# EAGLE design Breakout_board (EAGLE 9.6.2)
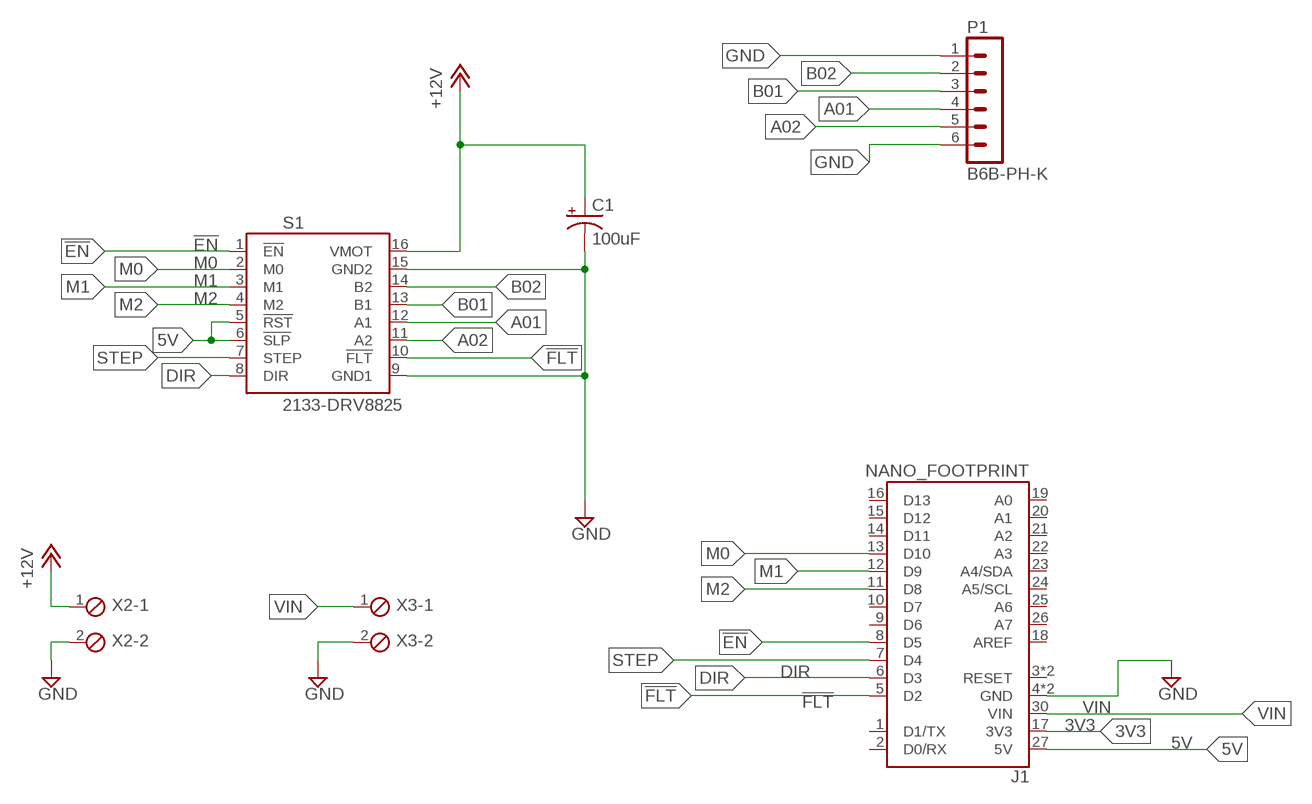
[diagram p0: schematic, sheet 1]

## Parts
C1  100uF  100UF-POLAR-EIA7343-16V-10%(TANT)  [EIA7343]
J1  NANO_FOOTPRINT  [NANO]
P1  B6B-PH-K  [B6B-PH-K]
S1  2133-DRV8825  [DRV8825]
X2  MPT2  [2POL254]
X3  MPT2  [2POL254]

## Nets
3V3: J1.17(3V3)
5V: J1.27(5V) S1.5(!RST) S1.6(!SLP)
!EN: J1.8(D5) S1.1(!EN)
!FLT: J1.5(D2) S1.10(!FLT)
+12V [H_Power]: C1.A(+) S1.16(VMOT) X2.1
A01 [X0]: P1.4 S1.12(A1)
A02 [X0]: P1.5 S1.11(A2)
B01 [X0]: P1.3 S1.13(B1)
B02 [X0]: P1.2 S1.14(B2)
DIR: J1.6(D3) S1.8(DIR)
GND [GND]: C1.C(-) J1.4(GND) J1.29(GND) P1.1 P1.6 S1.9(GND1) S1.15(GND2) X2.2 X3.2
M0: J1.13(D10) S1.2(M0)
M1: J1.12(D9) S1.3(M1)
M2: J1.11(D8) S1.4(M2)
STEP: J1.7(D4) S1.7(STEP)
VIN: J1.30(VIN) X3.1
Unconnected: J1.1(D1/TX) J1.2(D0/RX) J1.3(RESET) J1.9(D6) J1.10(D7) J1.14(D11) J1.15(D12) J1.16(D13) J1.18(AREF) J1.19(A0) J1.20(A1) J1.21(A2) J1.22(A3) J1.23(A4/SDA) J1.24(A5/SCL) J1.25(A6) J1.26(A7) J1.28(RESET)

## Library data of the parts
C1 = SparkFun-Capacitors:100UF-POLAR: 100µF polarized capacitors A capacitor is a passive two-terminal electrical component used to store electrical energy temporarily in an electric field.; PROD_ID: CAP-08702
J1 = SparkFun-Boards:NANO_FOOTPRINT: Generic Nano Footprint
P1 = con-jst-ph:B6B-PH-K: HEADER
S1 = pololu-stepper-driver:2133-DRV8825: DRV8825 Stepper Motor Driver Carrier, High Current #2133 DRV8825 Stepper Motor Driver Carrier; High Current <https://www.pololu.com/product/2133> in Japan, Suzaku Lab. Ltd. <https://suzakugiken.jp/> #2133 DRV8825 大電流用ステッピングモータドライバ <https://szc.jp/po2133>
X2 X3 = con-phoenix-254:MPT2: PHOENIX CONNECTOR; OC_FARNELL: unknown; OC_NEWARK: unknown

## Net classes
1 H_Power: width 0.305 mm

## Board
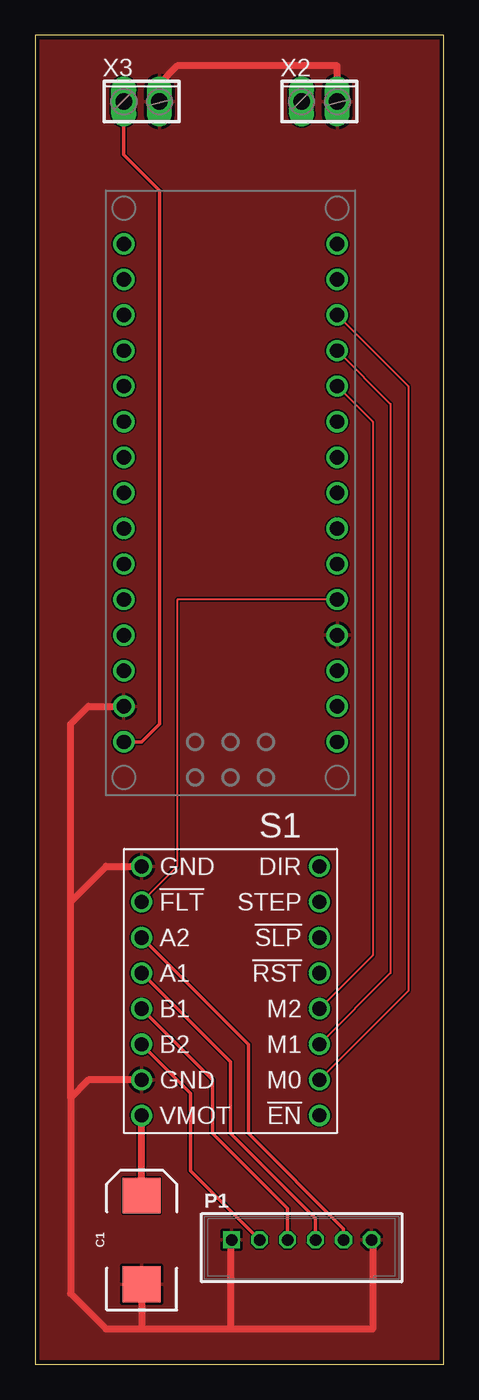
[diagram p1: board, top side]
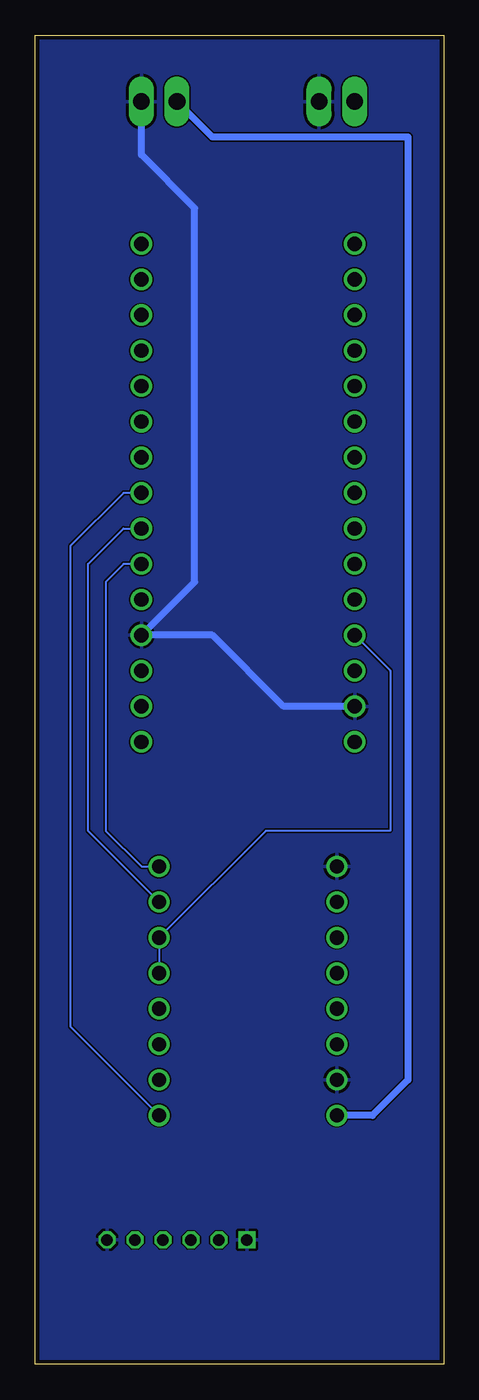
[diagram p2: board, bottom side, seen from below]

Size 29.19 x 94.92 mm. Coordinates in mm from the lower left corner, seen from the top.
Outline: 0,0 29.19,0 29.19,94.92 0,94.92 0,0
Copper layers (1*16): Top 0.035mm / dielectric 1.5mm / Bottom 0.035mm
Design rules "PCBWay_2L_100um-Track": minimum track width 0.1mm, minimum drill 0.3mm, track to track 0.1mm, track to pad 0.1mm, pad to pad 0.1mm, via to via 0.1mm, smd to smd 0mil, copper to edge 0.3mm, drill to drill 10mil, minimum pad ring 6mil, minimum via ring 0.1mm, stop-mask expansion 2mil, vias tented up to drill 0.45mm, thermal gap 0.2mm

### Footprints (pad centres in the part's own frame; a part is rotated, then mirrored left to right if it is on the bottom)
EIA7343 = smd 2.55 x 2.7: A 3.17,0; C -3.17,0
NANO = drill 1.016: 1 -7.62,17.78; 2 -7.62,15.24; 3 -7.62,12.7; 4 -7.62,10.16; 5 -7.62,7.62; 6 -7.62,5.08; 7 -7.62,2.54; 8 -7.62,0; 9 -7.62,-2.54; 10 -7.62,-5.08; 11 -7.62,-7.62; 12 -7.62,-10.16; 13 -7.62,-12.7; 14 -7.62,-15.24; 15 -7.62,-17.78; 16 7.62,-17.78; 17 7.62,-15.24; 18 7.62,-12.7; 19 7.62,-10.16; 20 7.62,-7.62; 21 7.62,-5.08; 22 7.62,-2.54; 23 7.62,0; 24 7.62,2.54; 25 7.62,5.08; 26 7.62,7.62; 27 7.62,10.16; 28 7.62,12.7; 29 7.62,15.24; 30 7.62,17.78
B6B-PH-K = drill 0.813 square: 1 -5,0 | drill 0.813 octagon: 2 -3,0; 3 -1,0; 4 1,0; 5 3,0; 6 5,0
DRV8825 = drill 1.016: 1 -6.35,8.89; 2 -6.35,6.35; 3 -6.35,3.81; 4 -6.35,1.27; 5 -6.35,-1.27; 6 -6.35,-3.81; 7 -6.35,-6.35; 8 -6.35,-8.89; 9 6.35,-8.89; 10 6.35,-6.35; 11 6.35,-3.81; 12 6.35,-1.27; 13 6.35,1.27; 14 6.35,3.81; 15 6.35,6.35; 16 6.35,8.89
2POL254 = drill 1.2 long: 1 -1.27,0; 2 1.27,0

### Placement (x,y rotation side)
C1  7.62,8.89 90 top
J1  13.97,62.23 180 top
P1  19.05,8.89 0 top
S1  13.97,26.67 180 top
X2  20.32,90.17 0 top
X3  7.62,90.17 0 top

### Tracks (layer width: path | path; a pad name or v marks a point on that pad's centre or on a via)
5V
  Bottom 0.152: J1.27 3.81,49.53 3.81,38.1 12.7,38.1 S1.6 S1.5
!EN
  Bottom 0.152: J1.8 22.86,62.23 26.67,58.42 26.67,24.13 S1.1
!FLT
  Top 0.152: J1.5 10.16,54.61 10.16,35.56 S1.10
+12V
  Top 0.508: C1.A S1.16
  Bottom 0.508: X2.1 16.51,87.63 2.54,87.63 2.54,20.32 5.08,17.78 S1.16
A01
  Top 0.254: S1.12 13.97,21.59 13.97,16.51 17.64,12.84 17.78,12.7 20.05,10.43 P1.4
A02
  Top 0.254: S1.11 15.24,22.86 15.24,16.51 22.05,9.7 P1.5
B01
  Top 0.254: S1.13 12.7,20.32 12.7,16.51 18.05,11.16 P1.3
B02
  Top 0.254: P1.2 11.12,13.81 11.12,19.36 S1.14
DIR
  Bottom 0.152: J1.6 22.86,57.15 24.13,55.88 24.13,38.1 21.59,35.56 S1.8
GND
  Top 0.305: P1.1 13.97,8.81
  Top 0.508: 2.54,19.05 2.54,33.02 | 2.54,33.02 5.08,35.56 S1.9 | S1.15 3.81,20.32 2.54,19.05 | 2.54,33.02 2.54,45.72 3.81,46.99 J1.29 | 7.62,2.54 5.08,2.54 2.54,5.08 2.54,19.05 | 7.62,2.54 13.97,2.54 | 13.97,2.54 24.13,2.54 24.13,8.81 P1.6 | X2.2 21.59,92.71 10.16,92.71 8.89,91.44 X3.2 | 13.97,8.81 13.97,2.54 | C1.C 7.62,2.54
  Bottom 0.508: J1.29 11.43,46.99 16.51,52.07 J1.4 17.78,55.88 17.78,82.55 21.59,86.36 X2.2
  pour Top (isolate 0.084): -3.81,96.52 31.75,96.52 31.75,-2.54 -3.81,-2.54
  pour Bottom (isolate 0.084): 31.75,-2.54 -3.81,-2.54 -3.81,96.52 31.75,96.52 33.02,95.25 33.02,-1.27
M0
  Top 0.152: J1.13 26.67,69.85 26.67,26.67 S1.2
M1
  Top 0.152: J1.12 25.4,68.58 25.4,27.94 S1.3
M2
  Top 0.152: J1.11 24.13,67.31 24.13,29.21 S1.4
STEP
  Bottom 0.152: S1.7 25.4,38.1 25.4,57.15 22.86,59.69 J1.7
VIN
  Top 0.254: X3.1 6.35,86.36 8.89,83.82 8.89,45.72 7.62,44.45 J1.30